# EAGLE schematic Esquema Mat (EAGLE 9.7.0)
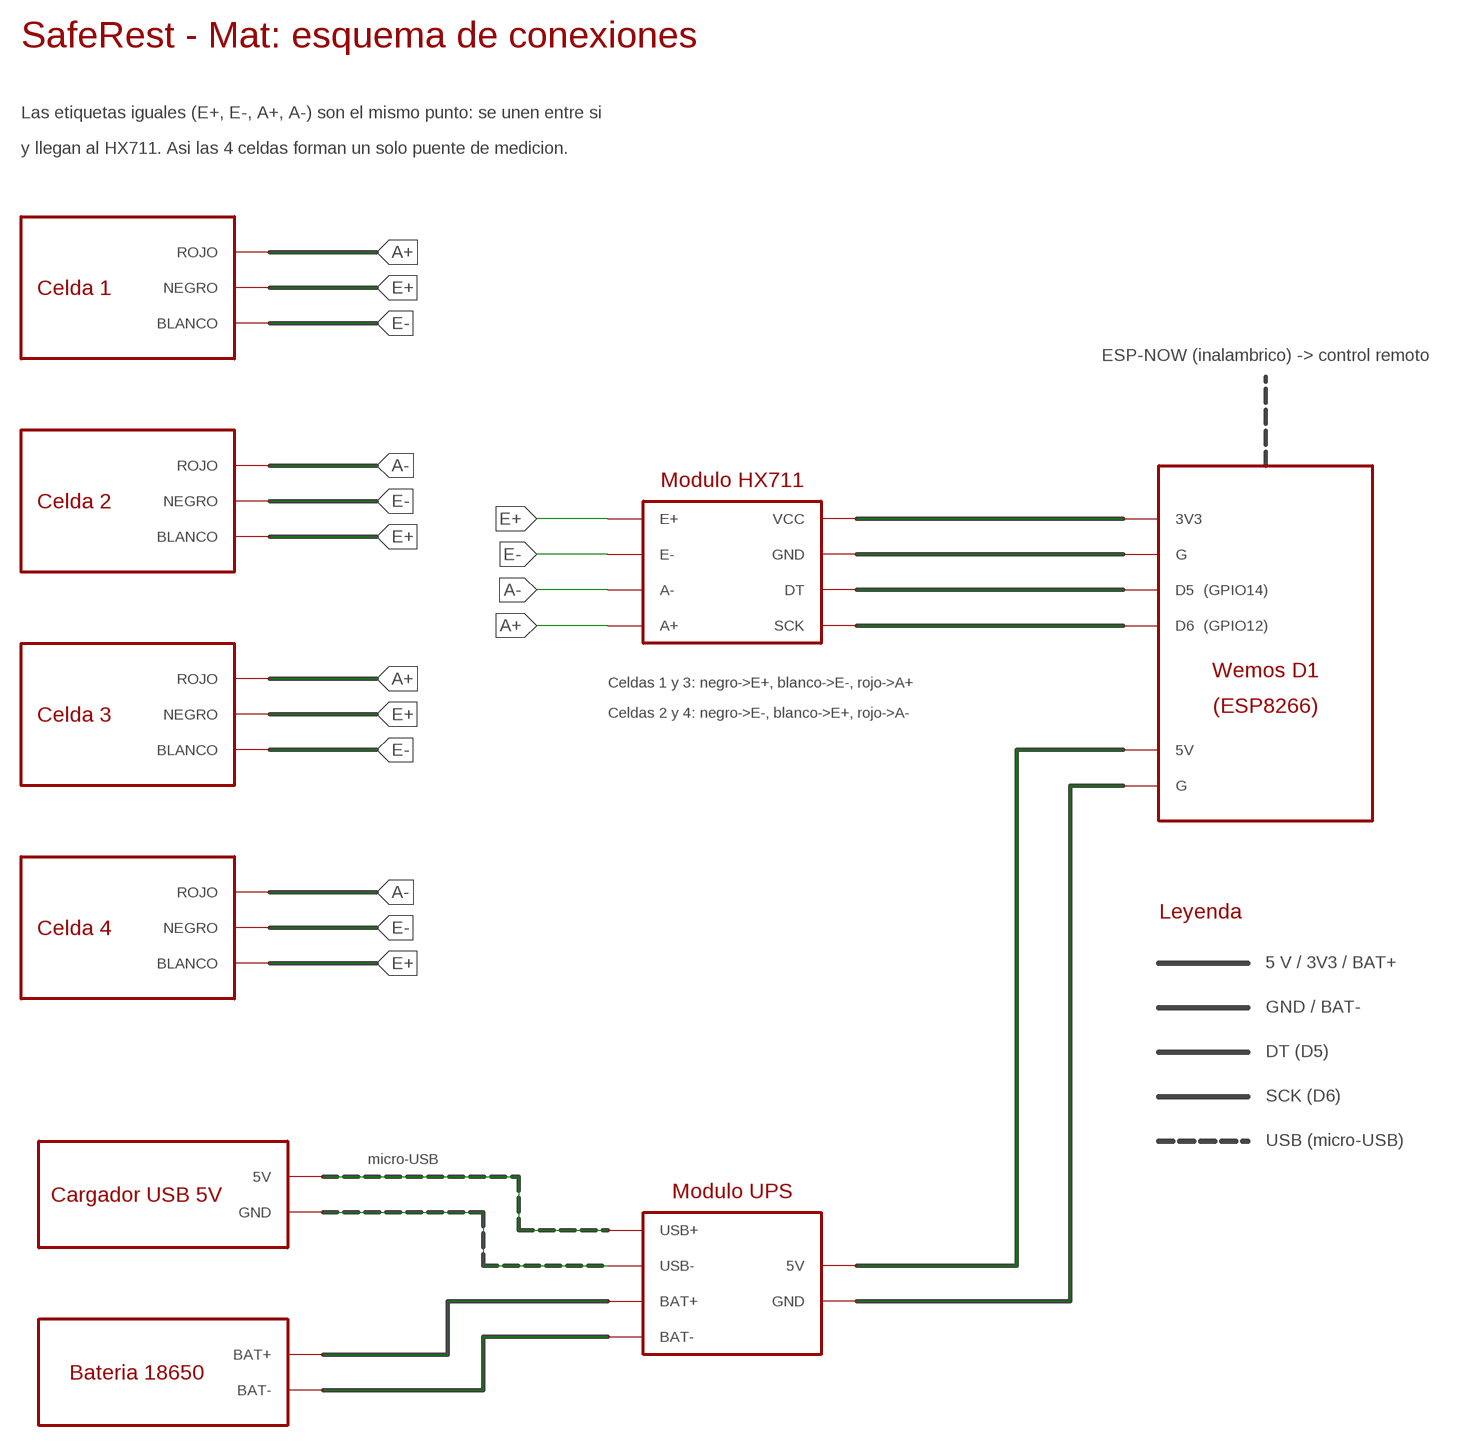
[diagram p0: schematic, sheet 1]

## Parts
BAT1  Bateria 18650  BATERIA_18650  [BATERIA_18650]
CELDA1  Celda 1  CELDA_CARGA  [CELDA_CARGA]
CELDA2  Celda 2  CELDA_CARGA  [CELDA_CARGA]
CELDA3  Celda 3  CELDA_CARGA  [CELDA_CARGA]
CELDA4  Celda 4  CELDA_CARGA  [CELDA_CARGA]
CHG1  Cargador USB 5V  CARGADOR_USB  [CARGADOR_USB]
MCU1  Wemos D1 (ESP8266)  WEMOS_D1  [WEMOS_D1]
U1  Modulo HX711  HX711  [HX711]
UPS1  Modulo UPS  MODULO_UPS  [MODULO_UPS]

## Nets
3V3: MCU1.1(3V3) U1.5(VCC)
5V: MCU1.5(5V) UPS1.5(5V)
A+: CELDA1.1(ROJO) CELDA3.1(ROJO) U1.4(A+)
A-: CELDA2.1(ROJO) CELDA4.1(ROJO) U1.3(A-)
BAT+: BAT1.1(BAT+) UPS1.3(BAT+)
BAT-: BAT1.2(BAT-) UPS1.4(BAT-)
DT: MCU1.3(D5) U1.7(DT)
E+: CELDA1.2(NEGRO) CELDA2.3(BLANCO) CELDA3.2(NEGRO) CELDA4.3(BLANCO) U1.1(E+)
E-: CELDA1.3(BLANCO) CELDA2.2(NEGRO) CELDA3.3(BLANCO) CELDA4.2(NEGRO) U1.2(E-)
GND: MCU1.2(G) MCU1.6(G) U1.6(GND) UPS1.6(GND)
SCK: MCU1.4(D6) U1.8(SCK)
USB5V: CHG1.1(5V) UPS1.1(USB+)
USBGND: CHG1.2(GND) UPS1.2(USB-)

## Notes on the sheet
- SafeRest - Mat: esquema de conexiones
- Las etiquetas iguales (E+, E-, A+, A-) son el mismo punto: se unen entre si
- y llegan al HX711. Asi las 4 celdas forman un solo puente de medicion.
- Celda 1
- ESP-NOW (inalambrico) -> control remoto
- Modulo HX711
- Celda 2
- (GPIO14)
- (GPIO12)
- Wemos D1
- Celdas 1 y 3: negro->E+, blanco->E-, rojo->A+
- (ESP8266)
- Celda 3 | Celdas 2 y 4: negro->E-, blanco->E+, rojo->A-
- Leyenda
- Celda 4
- 5 V / 3V3 / BAT+
- GND / BAT-
- DT (D5)
- SCK (D6)
- USB (micro-USB)
- micro-USB
- Cargador USB 5V | Modulo UPS
- Bateria 18650

## Library data of the parts
BAT1 = SafeRest:BATERIA_18650
CELDA1-CELDA4 = SafeRest:CELDA_CARGA
CHG1 = SafeRest:CARGADOR_USB
MCU1 = SafeRest:WEMOS_D1
U1 = SafeRest:HX711
UPS1 = SafeRest:MODULO_UPS